# Altium schematic sheet 扬声器_麦克风.schdoc
size 297 x 209 mm; Symbol: Drawing-Symbol_A4; Company: 嘉立创EDA; Version: V1.0; Page Size: A4; @Project Name: RK3566; @Update Date: 2026-10-03; @Create Date: 2026-05-25; Device: Drawing-Symbol_A4; @Board Name: Board1; @Page Name: P2; @Create Time: 01:28:12; @Page Count: 3; @Page No: 3; @Schematic Name: Schematic1; @Update Time: 01:28:12; @Assembly Variant: Basic; Border: 1; Title Block Position: 3; Size: A4; Width: 1170; Height: 825; Region Start: 1; X Region Count: 6; Y Region Count: 4; Blade Width: 10; SheetNumber: 9; SheetTotal: 11
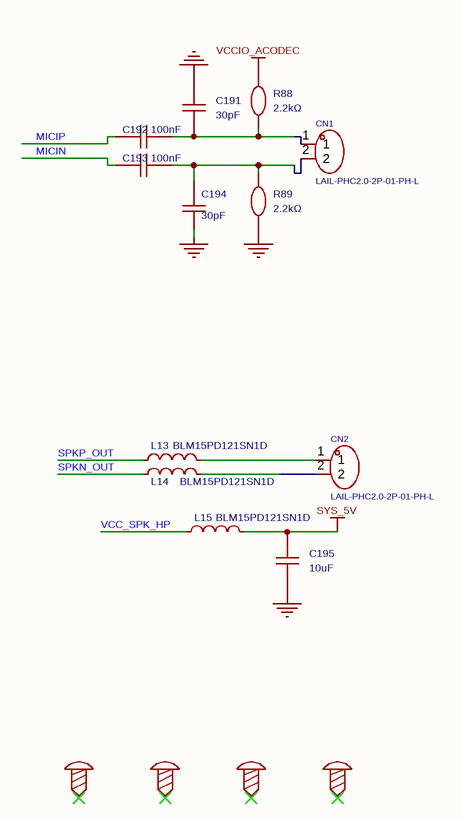
[diagram p0: 扬声器_麦克风.schdoc]

## Parts
C191  30pF  [C0402]
C192  100nF  [C0402]
C193  100nF  [C0402]
C194  30pF  [C0402]
C195  10uF  [C0402]
CN1  LAIL-PHC2.0-2P-01-PH-L  [CONN-TH_2P-P2.00_HC-PH-2A-TW]
CN2  LAIL-PHC2.0-2P-01-PH-L  [CONN-TH_2P-P2.00_HC-PH-2A-TW]
L13  BLM15PD121SN1D  [L0402]
L14  BLM15PD121SN1D  [L0402]
L15  BLM15PD121SN1D  [L0402]
R88  2.2kΩ  [R0402]
R89  2.2kΩ  [R0402]
SCREW1  (no value)  [M3螺丝]
SCREW2  (no value)  [M3螺丝]
SCREW3  (no value)  [M3螺丝]
SCREW4  (no value)  [M3螺丝]

## Nets
GND: C191.2 C194.1 C195.1 R89.1
SYS_5V: C195.2 L15.2
VCCIO_ACODEC: R88.2
MICIN: C193.1
MICIP: C192.1
SPKN_OUT: L14.1
SPKP_OUT: L13.1
VCC_SPK_HP: L15.1
NetC191_1: C191.1 C192.2 CN1.1 R88.1
NetC193_2: C193.2 C194.2 CN1.2 R89.2
NetCN2_1: CN2.1 L13.2
NetCN2_2: CN2.2 L14.2

Not connected (* = marked no-connect by the designer): SCREW1 1*; SCREW2 1*; SCREW3 1*; SCREW4 1*

## Notes on the sheet
- 创建日期
- 2026-10-03
- 原理图
- 板子
- Schematic1
- Board1
- 更新日期
- 图页
- P2
- 绘制
- 审阅
- RK3566
- 版本
- V1.0
- 尺寸
- A4
- 页    3    共    3
- 嘉立创EDA

## Library data of the parts
C191 C194 = CC0402FRNPO9BN300: 容值:30pF;精度:±1%;额定电压:50V;材质(温度系数):NP0;; Manufacturer: YAGEO(国巨); AddInBom: yes; ModelId: 36a51122f27c49738f86b3bfa98863e0聨0819f05c4eef4c71ace90d822a990e87; ModelName: C0402_L1.0-W0.5-H0.5; ModelTransform: 39.37,19.685,0,0,0,0,0,0,0; Tolerance: ±1%; Voltage Rated: 50V; Temperature Coefficient: NP0; Symbol: CC0402FRNPO9BN300; Device: CC0402FRNPO9BN300; LCSC Part Name: 30pF ±1% 50V; SupplierPart: C526980; ManufacturerPart: CC0402FRNPO9BN300; Supplier Footprint: 0402; JLCPCB Part Class: Extended Part; Datasheet: https://atta.szlcsc.com/upload/public/pdf/source/20200508/C526980_8BD9B2380CFF3BD9993DEB032B356E9B.pdf; Supplier: LCSC; ConvertToPcb: yes; FootprintName: C0402; Value: 30pF
C192 C193 = FCC0402B104K160AT: 容值:100nF;精度:±10%;额定电压:16V;温度系数:X7R;; Manufacturer: FOJAN(富捷); AddInBom: yes; ModelId: 36a51122f27c49738f86b3bfa98863e0聨0819f05c4eef4c71ace90d822a990e87; ModelName: C0402_L1.0-W0.5-H0.5; ModelTransform: 39.37,19.685,0,0,0,0,0,0,0; Tolerance: ±10%; Voltage Rating: 16V; Temperature Coefficient: X7R; Symbol: FCC0402B104K160AT; Device: FCC0402B104K160AT; LCSC Part Name: 100nF ±10% 16V; SupplierPart: C5137468; ManufacturerPart: FCC0402B104K160AT; Supplier Footprint: 0402; JLCPCB Part Class: Extended Part; Datasheet: https://item.szlcsc.com/datasheet/FCC0402B104K160AT/5746970.html; Supplier: LCSC; ConvertToPcb: yes; FootprintName: C0402; Value: 100nF; Operating Temperature: -55℃~+125℃
C195 = HGC0402R5106M100NTEJ: 容值:10uF;精度:±20%;额定电压:10V;温度系数:X5R;; Manufacturer: Chinocera(华瓷); 3D Model: 36a51122f27c49738f86b3bfa98863e0聨0819f05c4eef4c71ace90d822a990e87; 3D Model Transform: 39.37,19.685,0,0,0,0,0,0,0; Tolerance: ±20%; Voltage Rating: 10V; Temperature Coefficient: X5R; AddInBom: yes; ModelName: C0402_L1.0-W0.5-H0.5; Symbol: HGC0402R5106M100NTEJ; Device: HGC0402R5106M100NTEJ; LCSC Part Name: 10uF ±20% 10V; Supplier Part: C7472949; Manufacturer Part: HGC0402R5106M100NTEJ; Supplier Footprint: 0402; JLCPCB Part Class: Extended Part; Datasheet: https://item.szlcsc.com/datasheet/HGC0402R5106M100NTEJ/8532796.html; Supplier: LCSC; Value: 10uF; ConvertToPcb: yes; FootprintName: C0402
CN1 CN2 = LAIL-PHC2.0-2P-01-PH-L: 插针结构:1x2P;间距:2mm;安装方式:直插;参考系列:PH;总PIN数:2P;排数:1;每排PIN数:2;额定电流:2A;触头材质:黄铜;触头镀层:锡;工作温度:-25℃~+85℃;; Manufacturer: LAILAN(莱联); AddInBom: yes; ModelId: 5b53f0660d4141229bca89eb4238f4a6聨0819f05c4eef4c71ace90d822a990e87; ModelTransform: 236.22,189.3697,0,180,0,0,0,25.591,-133.858; Pins Structure: 1x2P; Pitch: 2mm; Reference Series: PH; Number of PINs Per Row: 2; Current Rating: 2A; Voltage Rating: 250V; Plastic Material: PA66; Flame Retardant Rating: UL94V-0; Z-Height of the Board: 6mm; Y-Width of Bottom Edge on Board: 4.7mm; Symbol: LAIL-PHC2.0-2P-01-PH-L; Device: LAIL-PHC2.0-2P-01-PH-L; LCSC Part Name: 1x2P 间距:2mm 直插 系列:PH; SupplierPart: C54905988; ManufacturerPart: LAIL-PHC2.0-2P-01-PH-L; Supplier Footprint: 插件,P=2mm; JLCPCB Part Class: Extended Part; Datasheet: https://item.szlcsc.com/datasheet/LAIL-PHC2.0-2P-01-PH-L/58431115.html; Supplier: LCSC; ConvertToPcb: yes; FootprintName: CONN-TH_2P-P2.00_HC-PH-2A-TW; ModelName: CONN-TH_2P-P2.00_HC-PH-2A-TW; Mounting Type: 直插; Number of Pins: 2P; Number of Rows: 1; Contact Material: 黄铜; Contact Plating: 锡; Operating Temperature: -25℃~+85℃; Color: 白色; X-Length of Bottom Edge on Board (Spacing Line): 6mm
L13-L15 = BLM15PD121SN1D: 阻抗@频率:120Ω@100MHz;误差:±25%;直流电阻(DCR):90mΩ;; Manufacturer: muRata(村田); AddInBom: yes; ModelId: d8d36575a3234d4790bfa765c88664a7聨0819f05c4eef4c71ace90d822a990e87; ModelName: L0402_L1.0-W0.5-H0.5_BEAD; ModelTransform: 39.37,19.685,0,0,0,0,0,0.0005,0; Tolerance: ±25%; DC Resistance(DCR): 90mΩ; Current Rating: 1.3A; Number of Circuits: 1; Symbol: BLM15PD121SN1D; Device: BLM15PD121SN1D; LCSC Part Name: 单路 0402磁珠 阻抗120Ω@100MHz; SupplierPart: C76891; ManufacturerPart: BLM15PD121SN1D; Supplier Footprint: 0402; JLCPCB Part Class: Extended Part; Datasheet: https://item.szlcsc.com/datasheet/BLM15PD121SN1D/78018.html; Supplier: LCSC; ConvertToPcb: yes; FootprintName: L0402; Impedance @ Frequency: 120Ω@100MHz; Operating Temperature: -55℃~+125℃
R88 R89 = FRC0402F2201TS: 电阻类型:厚膜电阻;阻值:2.2kΩ;精度:±1%;功率:62.5mW;工作电压:50V;温度系数:±100ppm/℃;; Manufacturer: FOJAN(富捷); AddInBom: yes; ModelId: 98c88bc2b9094f218f3a3e30a7012738聨0819f05c4eef4c71ace90d822a990e87; ModelName: R0402_L1.0-W0.5-H0.4; ModelTransform: 39.37,19.685,0,0,0,0,0,0,0; Tolerance: ±1%; Power(Watts): 62.5mW; Voltage-Supply(Max): 50V; Symbol: FRC0402F2201TS; Device: FRC0402F2201TS; LCSC Part Name: 2.2kΩ ±1% 62.5mW 厚膜电阻; SupplierPart: C2906865; ManufacturerPart: FRC0402F2201TS; Supplier Footprint: 0402; JLCPCB Part Class: Extended Part; Datasheet: https://item.szlcsc.com/datasheet/FRC0402F2201TS/3180378.html; Supplier: LCSC; ConvertToPcb: yes; FootprintName: R0402; Type: 厚膜电阻; Value: 2.2kΩ; Temperature Coefficient: ±100ppm/℃; Operating Temperature: -55℃~+155℃
SCREW1-SCREW4 = M3螺丝: Symbol: 螺丝孔; ConvertToPcb: yes; Device: M3螺丝; AddInBom: yes; Supplier Footprint: 插件; FootprintName: M3螺丝